# Altium project Hexapod_Board.PrjPcb (part 2 of 2)

## Sheet Servo_Signal_Ext.SchDoc
size A; DocumentNumber: 8; SheetNumber: 8; SheetTotal: 14
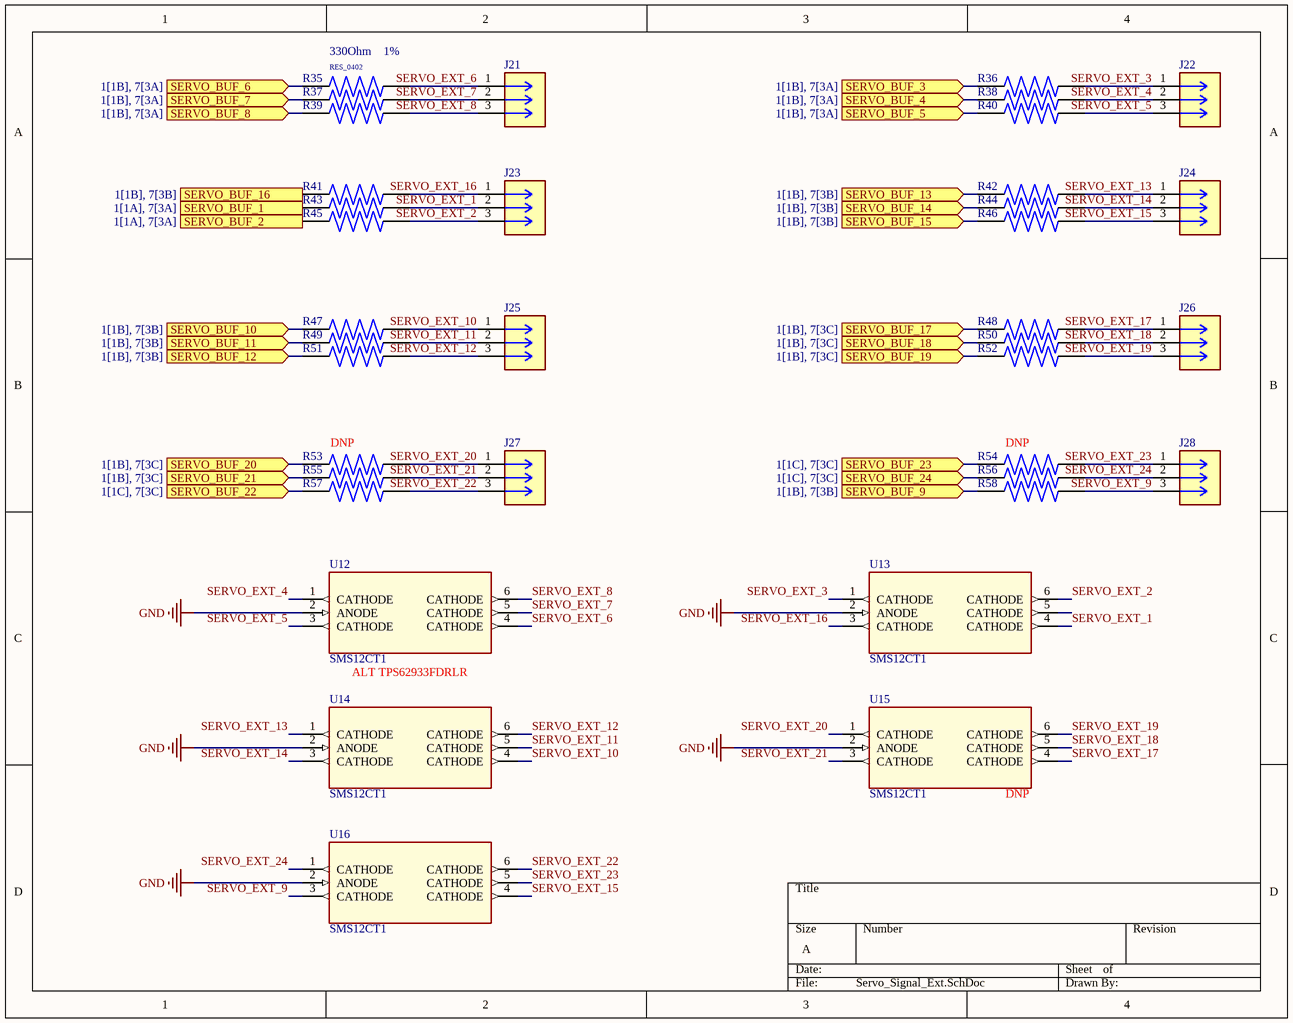
[diagram p12: Servo_Signal_Ext.SchDoc]

### Parts
J21  PIN_HEADER_1X3_2.54_VERTICAL  [PIN_HEADER_1X3_2.54_VERTICAL]  (value not drawn)
J22  PIN_HEADER_1X3_2.54_VERTICAL  [PIN_HEADER_1X3_2.54_VERTICAL]  (value not drawn)
J23  PIN_HEADER_1X3_2.54_VERTICAL  [PIN_HEADER_1X3_2.54_VERTICAL]  (value not drawn)
J24  PIN_HEADER_1X3_2.54_VERTICAL  [PIN_HEADER_1X3_2.54_VERTICAL]  (value not drawn)
J25  PIN_HEADER_1X3_2.54_VERTICAL  [PIN_HEADER_1X3_2.54_VERTICAL]  (value not drawn)
J26  PIN_HEADER_1X3_2.54_VERTICAL  [PIN_HEADER_1X3_2.54_VERTICAL]  (value not drawn)
J27  PIN_HEADER_1X3_2.54_VERTICAL  [PIN_HEADER_1X3_2.54_VERTICAL]  (value not drawn)
J28  PIN_HEADER_1X3_2.54_VERTICAL  [PIN_HEADER_1X3_2.54_VERTICAL]  (value not drawn)
R35  RES_0402  value 330Ohm  Tolerance: 1%  [RES_0402]
R36  RES_0402  [RES_0402]  (value not drawn)
R37  RES_0402  [RES_0402]  (value not drawn)
R38  RES_0402  [RES_0402]  (value not drawn)
R39  RES_0402  [RES_0402]  (value not drawn)
R40  RES_0402  [RES_0402]  (value not drawn)
R41  RES_0402  [RES_0402]  (value not drawn)
R42  RES_0402  [RES_0402]  (value not drawn)
R43  RES_0402  [RES_0402]  (value not drawn)
R44  RES_0402  [RES_0402]  (value not drawn)
R45  RES_0402  [RES_0402]  (value not drawn)
R46  RES_0402  [RES_0402]  (value not drawn)
R47  RES_0402  [RES_0402]  (value not drawn)
R48  RES_0402  [RES_0402]  (value not drawn)
R49  RES_0402  [RES_0402]  (value not drawn)
R50  RES_0402  [RES_0402]  (value not drawn)
R51  RES_0402  [RES_0402]  (value not drawn)
R52  RES_0402  [RES_0402]  (value not drawn)
R53  RES_0402  [RES_0402]  (value not drawn)
R54  RES_0402  [RES_0402]  (value not drawn)
R55  RES_0402  [RES_0402]  (value not drawn)
R56  RES_0402  [RES_0402]  (value not drawn)
R57  RES_0402  [RES_0402]  (value not drawn)
R58  RES_0402  [RES_0402]  (value not drawn)
U12  SMS12CT1  [SOT95P275X110-6N]
U13  SMS12CT1  [SOT95P275X110-6N]
U14  SMS12CT1  [SOT95P275X110-6N]
U15  SMS12CT1  [SOT95P275X110-6N]
U16  SMS12CT1  [SOT95P275X110-6N]

### Ports
SERVO_BUF_1 (in, see 1[1A], 7[3A]), SERVO_BUF_2 (in, see 1[1A], 7[3A]), SERVO_BUF_3 (in, see 1[1B], 7[3A]), SERVO_BUF_4 (in, see 1[1B], 7[3A]), SERVO_BUF_5 (in, see 1[1B], 7[3A]), SERVO_BUF_6 (in, see 1[1B], 7[3A]), SERVO_BUF_7 (in, see 1[1B], 7[3A]), SERVO_BUF_8 (in, see 1[1B], 7[3A]), SERVO_BUF_9 (in, see 1[1B], 7[3B]), SERVO_BUF_10 (in, see 1[1B], 7[3B]), SERVO_BUF_11 (in, see 1[1B], 7[3B]), SERVO_BUF_12 (in, see 1[1B], 7[3B]), SERVO_BUF_13 (in, see 1[1B], 7[3B]), SERVO_BUF_14 (in, see 1[1B], 7[3B]), SERVO_BUF_15 (in, see 1[1B], 7[3B]), SERVO_BUF_16 (in, see 1[1B], 7[3B]), SERVO_BUF_17 (in, see 1[1B], 7[3C]), SERVO_BUF_18 (in, see 1[1B], 7[3C]), SERVO_BUF_19 (in, see 1[1B], 7[3C]), SERVO_BUF_20 (in, see 1[1B], 7[3C]), SERVO_BUF_21 (in, see 1[1B], 7[3C]), SERVO_BUF_22 (in, see 1[1C], 7[3C]), SERVO_BUF_23 (in, see 1[1C], 7[3C]), SERVO_BUF_24 (in, see 1[1C], 7[3C])

### Nets
GND: U12.2(ANODE) U13.2(ANODE) U14.2(ANODE) U15.2(ANODE) U16.2(ANODE)
SERVO_EXT_1: J23.2 R43.1 U13.4(CATHODE)
SERVO_EXT_2: J23.3 R45.1 U13.6(CATHODE)
SERVO_EXT_3: J22.1 R36.1 U13.1(CATHODE)
SERVO_EXT_4: J22.2 R38.1 U12.1(CATHODE)
SERVO_EXT_5: J22.3 R40.1 U12.3(CATHODE)
SERVO_EXT_6: J21.1 R35.1 U12.4(CATHODE)
SERVO_EXT_7: J21.2 R37.1 U12.5(CATHODE)
SERVO_EXT_8: J21.3 R39.1 U12.6(CATHODE)
SERVO_EXT_9: J28.3 R58.1 U16.3(CATHODE)
SERVO_EXT_10: J25.1 R47.1 U14.4(CATHODE)
SERVO_EXT_11: J25.2 R49.1 U14.5(CATHODE)
SERVO_EXT_12: J25.3 R51.1 U14.6(CATHODE)
SERVO_EXT_13: J24.1 R42.1 U14.1(CATHODE)
SERVO_EXT_14: J24.2 R44.1 U14.3(CATHODE)
SERVO_EXT_15: J24.3 R46.1 U16.4(CATHODE)
SERVO_EXT_16: J23.1 R41.1 U13.3(CATHODE)
SERVO_EXT_17: J26.1 R48.1 U15.4(CATHODE)
SERVO_EXT_18: J26.2 R50.1 U15.5(CATHODE)
SERVO_EXT_19: J26.3 R52.1 U15.6(CATHODE)
SERVO_EXT_20: J27.1 R53.1 U15.1(CATHODE)
SERVO_EXT_21: J27.2 R55.1 U15.3(CATHODE)
SERVO_EXT_22: J27.3 R57.1 U16.6(CATHODE)
SERVO_EXT_23: J28.1 R54.1 U16.5(CATHODE)
SERVO_EXT_24: J28.2 R56.1 U16.1(CATHODE)
NetR35_2: R35.2 ; port SERVO_BUF_6
NetR36_2: R36.2 ; port SERVO_BUF_3
NetR37_2: R37.2 ; port SERVO_BUF_7
NetR38_2: R38.2 ; port SERVO_BUF_4
NetR39_2: R39.2 ; port SERVO_BUF_8
NetR40_2: R40.2 ; port SERVO_BUF_5
NetR41_2: R41.2 ; port SERVO_BUF_16
NetR42_2: R42.2 ; port SERVO_BUF_13
NetR43_2: R43.2 ; port SERVO_BUF_1
NetR44_2: R44.2 ; port SERVO_BUF_14
NetR45_2: R45.2 ; port SERVO_BUF_2
NetR46_2: R46.2 ; port SERVO_BUF_15
NetR47_2: R47.2 ; port SERVO_BUF_10
NetR48_2: R48.2 ; port SERVO_BUF_17
NetR49_2: R49.2 ; port SERVO_BUF_11
NetR50_2: R50.2 ; port SERVO_BUF_18
NetR51_2: R51.2 ; port SERVO_BUF_12
NetR52_2: R52.2 ; port SERVO_BUF_19
NetR53_2: R53.2 ; port SERVO_BUF_20
NetR54_2: R54.2 ; port SERVO_BUF_23
NetR55_2: R55.2 ; port SERVO_BUF_21
NetR56_2: R56.2 ; port SERVO_BUF_24
NetR57_2: R57.2 ; port SERVO_BUF_22
NetR58_2: R58.2 ; port SERVO_BUF_9

Not connected (* = marked no-connect by the designer): U13 5(CATHODE)

### Notes on the sheet
- (near R53) DNP
- (near R54) DNP
- ALT TPS62933FDRLR
- (near U15) DNP

### Library data of the parts
J21-J28 = PIN_HEADER_3P: GENERIC PIN HEADER 3P; MPN: 10129378-903001BLF; MF: Amphenol; LCSC Part Number: C5470076
R35 = RES: GENERIC RES; MPN: RC0402FR-07330RL; Power Rating: *; Rated Voltage: *; Temperature Coefficient: *; LCSC Part Number: C105875
R36-R58 = RES: GENERIC RES; MPN: RC0402FR-07330RL; Tolerance: 1%; Value: 330Ohm; Power Rating: *; Rated Voltage: *; Temperature Coefficient: *; LCSC Part Number: C105875
U12-U16 = SMS12CT1: 23V Clamp 15A (8/20µs) Ipp Tvs Diode Surface Mount SC-74; MP: onsemi; MPN: SMS12CT1

## Sheet Serial_Interface_UART.SchDoc
size A; DocumentNumber: 11; SheetNumber: 11; SheetTotal: 14
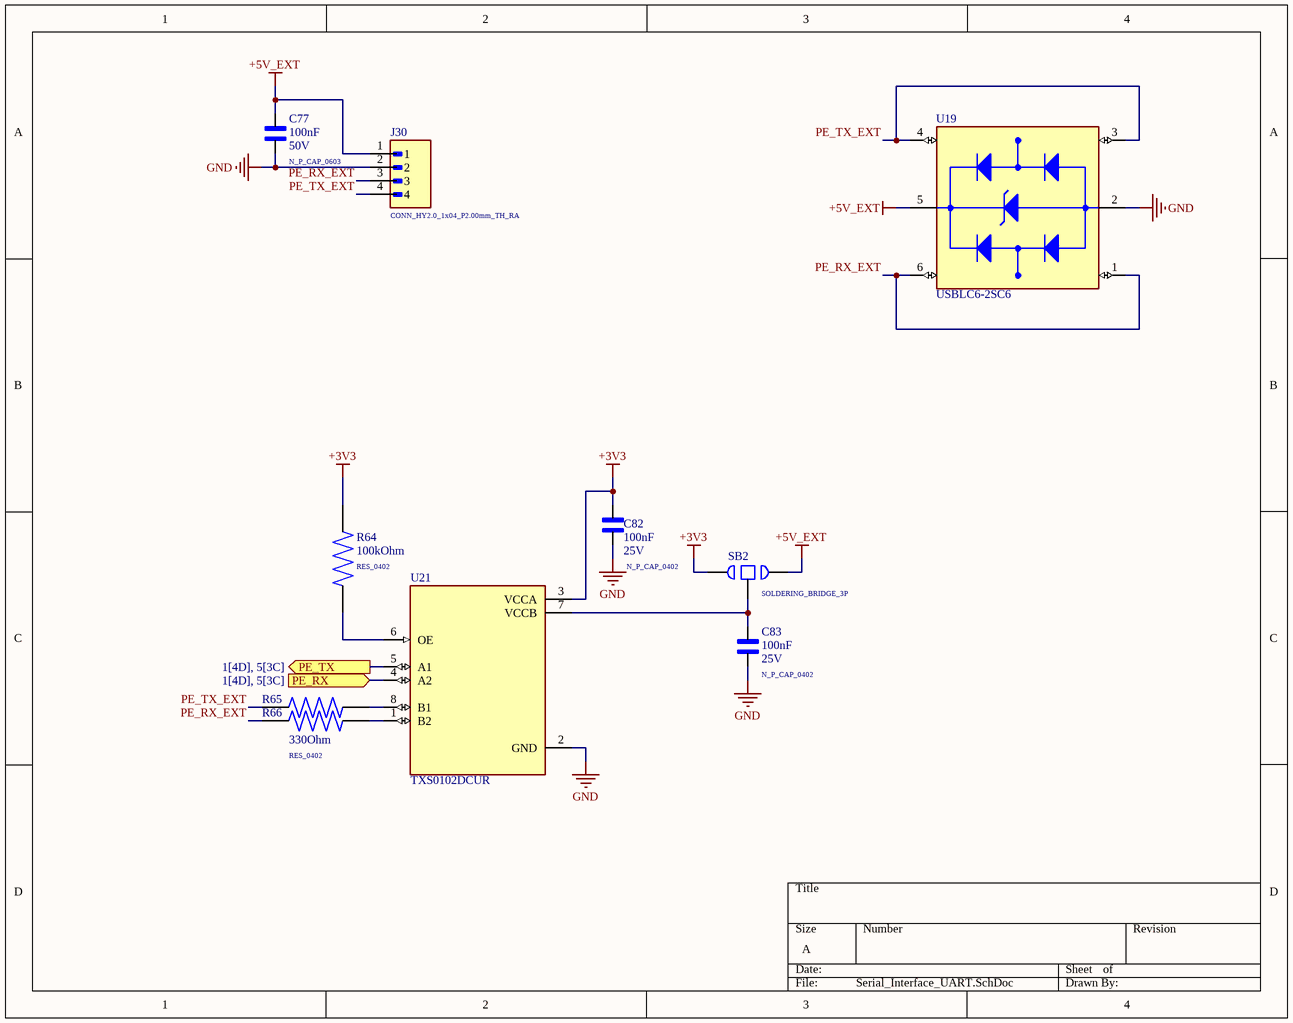
[diagram p13: Serial_Interface_UART.SchDoc]

### Parts
C77  N_P_CAP_0603  value 100nF  Rated Voltage: 50V  [N_P_CAP_0603]
C82  N_P_CAP_0402  value 100nF  Rated Voltage: 25V  [N_P_CAP_0402]
C83  N_P_CAP_0402  value 100nF  Rated Voltage: 25V  [N_P_CAP_0402]
J30  CONN_HY2.0_1x04_P2.00mm_TH_RA  [CONN_HY2.0_1x04_P2.00mm_TH_RA]
R64  RES_0402  value 100kOhm  [RES_0402]
R65  RES_0402  [RES_0402]  (value not drawn)
R66  RES_0402  value 330Ohm  [RES_0402]
SB2  SOLDERING_BRIDGE_3P  [SOLDERING_BRIDGE_3P]  (no BOM)
U19  USBLC6-2SC6  [SOT95P280X145-6N]
U21  TXS0102DCUR  [SOP50P310X90-8N]

### Ports
PE_RX (in, see 1[4D], 5[3C]), PE_TX (out, see 1[4D], 5[3C])

### Nets
+3V3: C82.2 R64.1 SB2.1 U21.3(VCCA)
+5V_EXT: C77.2 J30.1 SB2.2 U19.5(VBUS)
GND: C77.1 C82.1 C83.1 J30.2 U19.2(GND) U21.2(GND)
PE_RX_EXT: J30.3 R66.2 U19.1(I/O1_IN) U19.6(I/O1_OUT)
PE_TX_EXT: J30.4 R65.2 U19.3(I/O2_IN) U19.4(I/O2_OUT)
NetC83_2: C83.2 SB2.3 U21.7(VCCB)
NetR64_2: R64.2 U21.6(OE)
NetR65_1: R65.1 U21.8(B1)
NetR66_1: R66.1 U21.1(B2)
NetU7_13: U21.5(A1) ; port PE_TX
NetU7_14: U21.4(A2) ; port PE_RX

### Library data of the parts
C77 = N_P_CAP: GENERIC NON-POLARIZED CAP; LCSC Part Number: C106221; Tolerance: *; MF: *; ESR: *; MPN: *; Temperature Coefficient: *
C82 C83 = N_P_CAP: GENERIC NON-POLARIZED CAP; Temperature Coefficient: X7R; LCSC Part Number: C105883; Tolerance: *; MF: *; ESR: *; MPN: *
J30 = CONN_4P: GENERIC CONNECTOR 4P; MF: *; MPN: *; LCSC Part Number: C55381784
R64 = RES: GENERIC RES; Tolerance: 1%; Power Rating: *; MPN: *; Rated Voltage: *; Temperature Coefficient: *; LCSC Part Number: C60491
R65 = RES: as R36 on sheet Servo_Signal_Ext; Power Rating: *; Rated Voltage: *; Temperature Coefficient: *; LCSC Part Number: C105875
R66 = RES: as R63 on sheet Serial_Interface_I2C; Power Rating: *; Rated Voltage: *; Temperature Coefficient: *; LCSC Part Number: C105875
SB2 = SOLDERING_BRIDGE_3P: GENERIC SOLDERING BRIDGE 3P
U19 = USBLC6-2SC6: 17V Clamp 5A (8/20Âµs) Ipp Tvs Diode Surface Mount SOT-23-6; MF: STMicroelectronics; Package: SOT-23-6 STMicroelectronics; MPN: USBLC6-2SC6; LCSC Part Number: C7519
U21 = TXS0102DCUR: 2-Bit Bidirectional Voltage-Level Shifter for Open-Drain and Push-Pull Application; MF: Texas Instruments; Package: VSSOP-8 Texas Instruments; MPN: TXS0102DCUR

## Nets that join several sheets
+3V3: MCU_STM (19 pins), Indicator (R75.1 R76.1 R77.1), Serial_Interface_I2C (C80.2 R61.1 SB1.1 U20.3), Servo_Signal_Buf (R33.1), Input (R73.1 R74.1), MCU_ESP (7 pins), IMU (C74.2 C75.2 U17.5 U17.8), Power_Input (5 pins), Power_Regulators (8 pins), Serial_Interface_UART (C82.2 R64.1 SB2.1 U21.3)
+5V_EXT: Serial_Interface_I2C (C76.2 J29.1 SB1.2 U18.5), Power_Regulators (5 pins), Serial_Interface_UART (C77.2 J30.1 SB2.2 U19.5)
+5V_INT: Indicator (D8.1 LS1.P), Servo_Signal_Buf (6 pins), Power_Regulators (5 pins)
+VBAT_SYS: Power_Input (R10.1 R12.2 TP4.TP), Servo_Power (48 pins), Power_Regulators (FB1.1)
GND: MCU_STM (26 pins), Indicator (Q8.2 R79.1), Serial_Interface_I2C (6 pins), Servo_Signal_Buf (7 pins), Input (6 pins), MCU_ESP (20 pins), IMU (6 pins), Power_Input (13 pins), Servo_Power (48 pins), Power_Regulators (30 pins), Servo_Signal_Ext (5 pins), Serial_Interface_UART (6 pins)
IO0: Input (C79.2 R74.2 SW6.1 SW6.2), MCU_ESP (J4.3 R30.2 U7.25 U8.2)
NetC78_2: MCU_STM (U5.25), Input (C78.2 R73.2 SW5.1 SW5.2)
NetD5_1: MCU_STM (U5.39), Indicator (D5.1)
NetD6_1: MCU_STM (U5.40), Indicator (D6.1)
NetD7_1: Indicator (D7.1), MCU_ESP (U7.24)
NetR6_1: MCU_STM (U5.51), Power_Input (R6.1 U1.5)
NetR7_1: MCU_STM (U5.52), Power_Input (R7.1 U1.4)
NetR9_1: Servo_Signal_Buf (5 pins), Power_Input (R9.1)
NetR11_2: MCU_STM (U5.53), Power_Input (R11.2)
NetR29_2: MCU_STM (U5.33), MCU_ESP (R29.2)
NetR30_1: MCU_STM (U5.34), MCU_ESP (R30.1)
NetR31_2: MCU_STM (U5.38), MCU_ESP (R31.2)
NetR32_2: MCU_STM (U5.37), MCU_ESP (R32.2)
NetR35_2: Servo_Signal_Buf (U9.13), Servo_Signal_Ext (R35.2)
NetR36_2: Servo_Signal_Buf (U9.16), Servo_Signal_Ext (R36.2)
NetR37_2: Servo_Signal_Buf (U9.12), Servo_Signal_Ext (R37.2)
NetR38_2: Servo_Signal_Buf (U9.15), Servo_Signal_Ext (R38.2)
NetR39_2: Servo_Signal_Buf (U9.11), Servo_Signal_Ext (R39.2)
NetR40_2: Servo_Signal_Buf (U9.14), Servo_Signal_Ext (R40.2)
NetR41_2: Servo_Signal_Buf (U10.11), Servo_Signal_Ext (R41.2)
NetR42_2: Servo_Signal_Buf (U10.14), Servo_Signal_Ext (R42.2)
NetR43_2: Servo_Signal_Buf (U9.18), Servo_Signal_Ext (R43.2)
NetR44_2: Servo_Signal_Buf (U10.13), Servo_Signal_Ext (R44.2)
NetR45_2: Servo_Signal_Buf (U9.17), Servo_Signal_Ext (R45.2)
NetR46_2: Servo_Signal_Buf (U10.12), Servo_Signal_Ext (R46.2)
NetR47_2: Servo_Signal_Buf (U10.17), Servo_Signal_Ext (R47.2)
NetR48_2: Servo_Signal_Buf (U11.18), Servo_Signal_Ext (R48.2)
NetR49_2: Servo_Signal_Buf (U10.16), Servo_Signal_Ext (R49.2)
NetR50_2: Servo_Signal_Buf (U11.17), Servo_Signal_Ext (R50.2)
NetR51_2: Servo_Signal_Buf (U10.15), Servo_Signal_Ext (R51.2)
NetR52_2: Servo_Signal_Buf (U11.16), Servo_Signal_Ext (R52.2)
NetR53_2: Servo_Signal_Buf (U11.15), Servo_Signal_Ext (R53.2)
NetR54_2: Servo_Signal_Buf (U11.12), Servo_Signal_Ext (R54.2)
NetR55_2: Servo_Signal_Buf (U11.14), Servo_Signal_Ext (R55.2)
NetR56_2: Servo_Signal_Buf (U11.11), Servo_Signal_Ext (R56.2)
NetR57_2: Servo_Signal_Buf (U11.13), Servo_Signal_Ext (R57.2)
NetR58_2: Servo_Signal_Buf (U10.18), Servo_Signal_Ext (R58.2)
NetR78_2: MCU_STM (U5.16), Indicator (R78.2)
NetSW4_1: MCU_STM (U5.10), Servo_Signal_Buf (SW4.1)
NetU5_14: MCU_STM (U5.14), Servo_Signal_Buf (U11.8)
NetU5_15: MCU_STM (U5.15), Servo_Signal_Buf (U11.9)
NetU5_17: MCU_STM (U5.17), Servo_Signal_Buf (U10.2)
NetU5_20: MCU_STM (U5.20), IMU (U17.12)
NetU5_21: MCU_STM (U5.21), IMU (U17.13)
NetU5_22: MCU_STM (U5.22), IMU (U17.1)
NetU5_23: MCU_STM (U5.23), IMU (U17.14)
NetU5_24: MCU_STM (U5.24), IMU (U17.4)
NetU5_26: MCU_STM (U5.26), Servo_Signal_Buf (U10.3)
NetU5_27: MCU_STM (U5.27), Servo_Signal_Buf (U10.4)
NetU5_29: MCU_STM (U5.29), Servo_Signal_Buf (U10.5)
NetU5_41: MCU_STM (U5.41), Servo_Signal_Buf (U9.9)
NetU5_42: MCU_STM (U5.42), Servo_Signal_Buf (U9.8)
NetU5_43: MCU_STM (U5.43), Servo_Signal_Buf (U9.7)
NetU5_44: MCU_STM (U5.44), Servo_Signal_Buf (U9.6)
NetU5_50: MCU_STM (U5.50), Servo_Signal_Buf (U9.5)
NetU5_55: MCU_STM (U5.55), Servo_Signal_Buf (U9.4)
NetU5_56: MCU_STM (U5.56), Servo_Signal_Buf (U9.3)
NetU5_57: MCU_STM (U5.57), Servo_Signal_Buf (U9.2)
NetU5_58: MCU_STM (U5.58), Servo_Signal_Buf (U10.9)
NetU5_59: MCU_STM (U5.59), Servo_Signal_Buf (U10.8)
NetU5_61: MCU_STM (U5.61), Servo_Signal_Buf (U10.7)
NetU5_62: MCU_STM (U5.62), Servo_Signal_Buf (U10.6)
NetU7_11: Serial_Interface_I2C (U20.5), MCU_ESP (U7.11)
NetU7_12: Serial_Interface_I2C (U20.4), MCU_ESP (U7.12)
NetU7_13: MCU_ESP (U7.13), Serial_Interface_UART (U21.5)
NetU7_14: MCU_ESP (U7.14), Serial_Interface_UART (U21.4)
NetU7_26: Servo_Signal_Buf (U11.7), MCU_ESP (U7.26)
NetU7_27: Servo_Signal_Buf (U11.6), MCU_ESP (U7.27)
NetU7_28: Servo_Signal_Buf (U11.5), MCU_ESP (U7.28)
NetU7_29: Servo_Signal_Buf (U11.4), MCU_ESP (U7.29)
NetU7_30: Servo_Signal_Buf (U11.3), MCU_ESP (U7.30)
NetU7_31: Servo_Signal_Buf (U11.2), MCU_ESP (U7.31)

## Assembly variants
STANDARD: all parts fitted
LITE: all parts fitted